# Altium schematic sheet Outputs.SchDoc
size A4
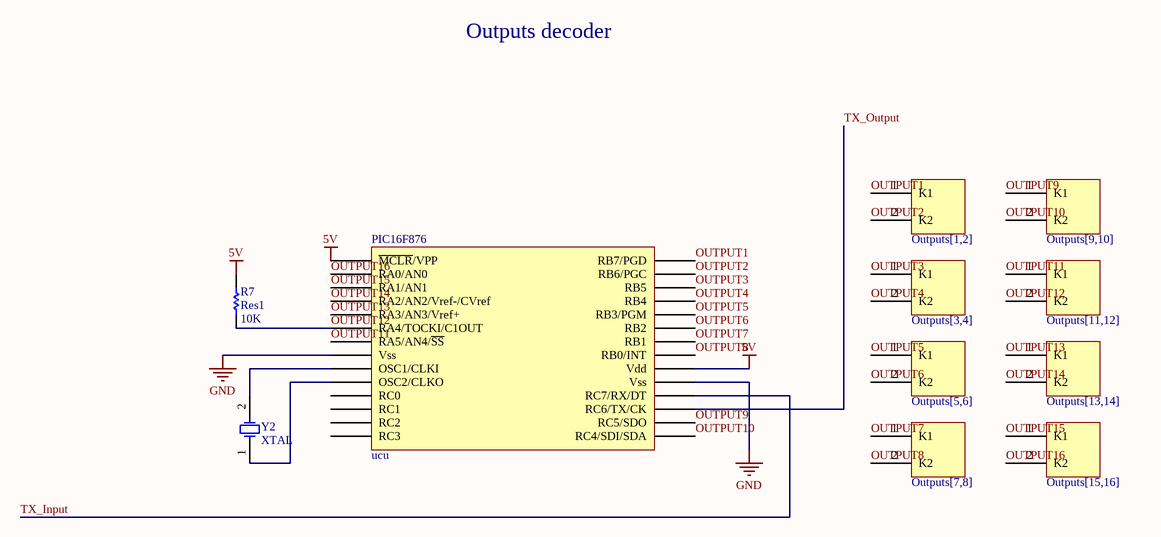
[diagram p0: Outputs.SchDoc]

## Parts
Outputs[1,2]  Klema  [Klema]  (value not drawn)
Outputs[3,4]  Klema  [Klema]  (value not drawn)
Outputs[5,6]  Klema  [Klema]  (value not drawn)
Outputs[7,8]  Klema  [Klema]  (value not drawn)
Outputs[9,10]  Klema  [Klema]  (value not drawn)
Outputs[11,12]  Klema  [Klema]  (value not drawn)
Outputs[13,14]  Klema  [Klema]  (value not drawn)
Outputs[15,16]  Klema  [Klema]  (value not drawn)
PIC16F876  ucu  [DIP28]
R7  Res1  value 10K  [AXIAL-0.3]
Y2  XTAL  [Kristal]

## Nets
5V: PIC16F876.1(~{MCLR}/VPP) PIC16F876.20(Vdd) R7.2
GND: PIC16F876.8(Vss) PIC16F876.19(Vss)
OUTPUT1: Outputs[1,2].1(K1) PIC16F876.28(RB7/PGD)
OUTPUT2: Outputs[1,2].2(K2) PIC16F876.27(RB6/PGC)
OUTPUT3: Outputs[3,4].1(K1) PIC16F876.26(RB5)
OUTPUT4: Outputs[3,4].2(K2) PIC16F876.25(RB4)
OUTPUT5: Outputs[5,6].1(K1) PIC16F876.24(RB3/PGM)
OUTPUT6: Outputs[5,6].2(K2) PIC16F876.23(RB2)
OUTPUT7: Outputs[7,8].1(K1) PIC16F876.22(RB1)
OUTPUT8: Outputs[7,8].2(K2) PIC16F876.21(RB0/INT)
OUTPUT9: Outputs[9,10].1(K1) PIC16F876.16(RC5/SDO)
OUTPUT10: Outputs[9,10].2(K2) PIC16F876.15(RC4/SDI/SDA)
OUTPUT11: Outputs[11,12].1(K1) PIC16F876.7(RA5/AN4/~{SS})
OUTPUT12: Outputs[11,12].2(K2) PIC16F876.6(RA4/TOCKI/C1OUT) R7.1
OUTPUT13: Outputs[13,14].1(K1) PIC16F876.5(RA3/AN3/Vref+)
OUTPUT14: Outputs[13,14].2(K2) PIC16F876.4(RA2/AN2/Vref-/CVref)
OUTPUT15: Outputs[15,16].1(K1) PIC16F876.3(RA1/AN1)
OUTPUT16: Outputs[15,16].2(K2) PIC16F876.2(RA0/AN0)
TX_Input: PIC16F876.18(RC7/RX/DT)
TX_Output: PIC16F876.17(RC6/TX/CK)
NetPIC16F876_9: PIC16F876.9(OSC1/CLKI) Y2.2(OSC2)
NetPIC16F876_10: PIC16F876.10(OSC2/CLKO) Y2.1(OSC1)

Not connected (* = marked no-connect by the designer): PIC16F876 11(RC0) 12(RC1) 13(RC2) 14(RC3)

## Notes on the sheet
- Outputs decoder

## Library data of the parts
PIC16F876 = PIC16F876: PIC16F876 microcontroller
R7 = Res1: Resistor; Published: 8-Jun-2000; LatestRevisionDate: 17-Jul-2002; LatestRevisionNote: Re-released for DXP Platform.; PackageReference: AXIAL-0.3; Publisher: Altium Limited; PackageDescription: Axial Device, Thru-Hole; 2 Leads; 0.3 in Pin Spacing
Y2 = XTAL: Crystal Oscillator; Published: 8-Jun-2000; LatestRevisionDate: 17-Jul-2002; LatestRevisionNote: Re-released for DXP Platform.; PackageReference: R38; Publisher: Altium Limited; PackageDescription: Crystal, Thru-Hole; 2 Leads; Body 3.1 x 8.2 mm (Dia.xH)